# Altium schematic sheet 000_Hierarchical.SchDoc: Hierarchical system
size A4; Date: *xxxxxx; DrawnBy: *J.A.Oviedo; Revision: R1V0; SheetNumber: 1; SheetTotal: 5
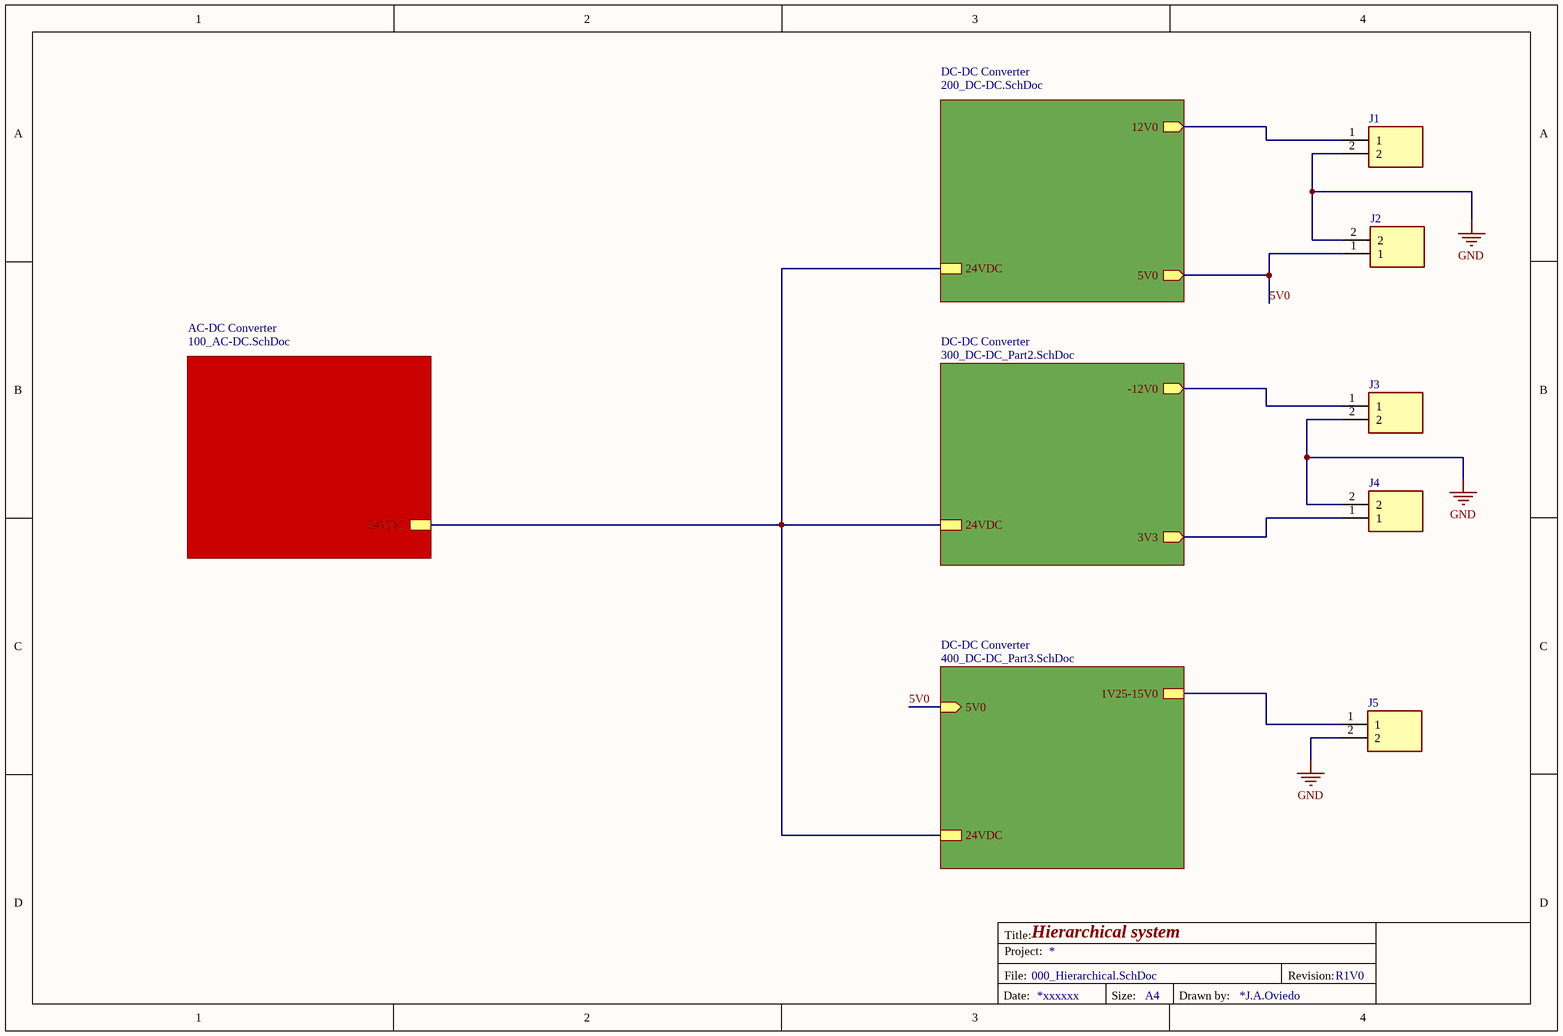
[diagram p0: 000_Hierarchical.SchDoc]

## Parts
J1  Con_2*1_TH_5mm_14.3*10.5_300V_15A  [Con_2*1_TH_5mm_14.3*10.5_300V_15A]  (value not drawn)
J2  Con_2*1_TH_5mm_14.3*10.5_300V_15A  [Con_2*1_TH_5mm_14.3*10.5_300V_15A]  (value not drawn)
J3  Con_2*1_TH_5mm_14.3*10.5_300V_15A  [Con_2*1_TH_5mm_14.3*10.5_300V_15A]  (value not drawn)
J4  Con_2*1_TH_5mm_14.3*10.5_300V_15A  [Con_2*1_TH_5mm_14.3*10.5_300V_15A]  (value not drawn)
J5  Con_2*1_TH_5mm_14.3*10.5_300V_15A  [Con_2*1_TH_5mm_14.3*10.5_300V_15A]  (value not drawn)

## Sub-sheets
AC-DC Converter = 100_AC-DC.SchDoc: 24VDC
DC-DC Converter = 200_DC-DC.SchDoc: 24VDC, 12V0 (out), 5V0 (out)
DC-DC Converter = 300_DC-DC_Part2.SchDoc: 24VDC, -12V0 (out), 3V3 (out)
DC-DC Converter = 400_DC-DC_Part3.SchDoc: 24VDC, 1V25-15V0, 5V0 (in)

## Nets
GND: J1.2 J2.2 J3.2 J4.2 J5.2
5V0: J2.1 ; sheet DC-DC Converter/5V0, sheet DC-DC Converter/5V0
NetJ1_1: J1.1 ; sheet DC-DC Converter/12V0
NetJ3_1: J3.1 ; sheet DC-DC Converter/-12V0
NetJ4_1: J4.1 ; sheet DC-DC Converter/3V3
NetJ5_1: J5.1 ; sheet DC-DC Converter/1V25-15V0
(unnamed): sheet AC-DC Converter/24VDC, sheet DC-DC Converter/24VDC, sheet DC-DC Converter/24VDC, sheet DC-DC Converter/24VDC

## Notes on the sheet
- Title:
- Project:
- File:
- Revision:
- Date:
- Size:
- A4
- Drawn by:

## Library data of the parts
J1-J5 = Con_2*1_TH_5mm_14.3*10.5_300V_15A: 2 Bloques de terminales - Cable a placa Horizontal con placa 0.197" (5.00mm) Orificio pasante; Manufacturer: Same Sky (Formerly CUI Devices); Manufacturer Part Number: TB002-500-02BE; Supplier 1: Digi-key; Supplier Part Number 1: 102-6145-ND; Reel Stock: N/A; Last modified by: J.A.Oviedo; Last modified date: 20261021